# Altium schematic sheet Power.SchDoc
size A; SheetNumber: 5; SheetTotal: 8
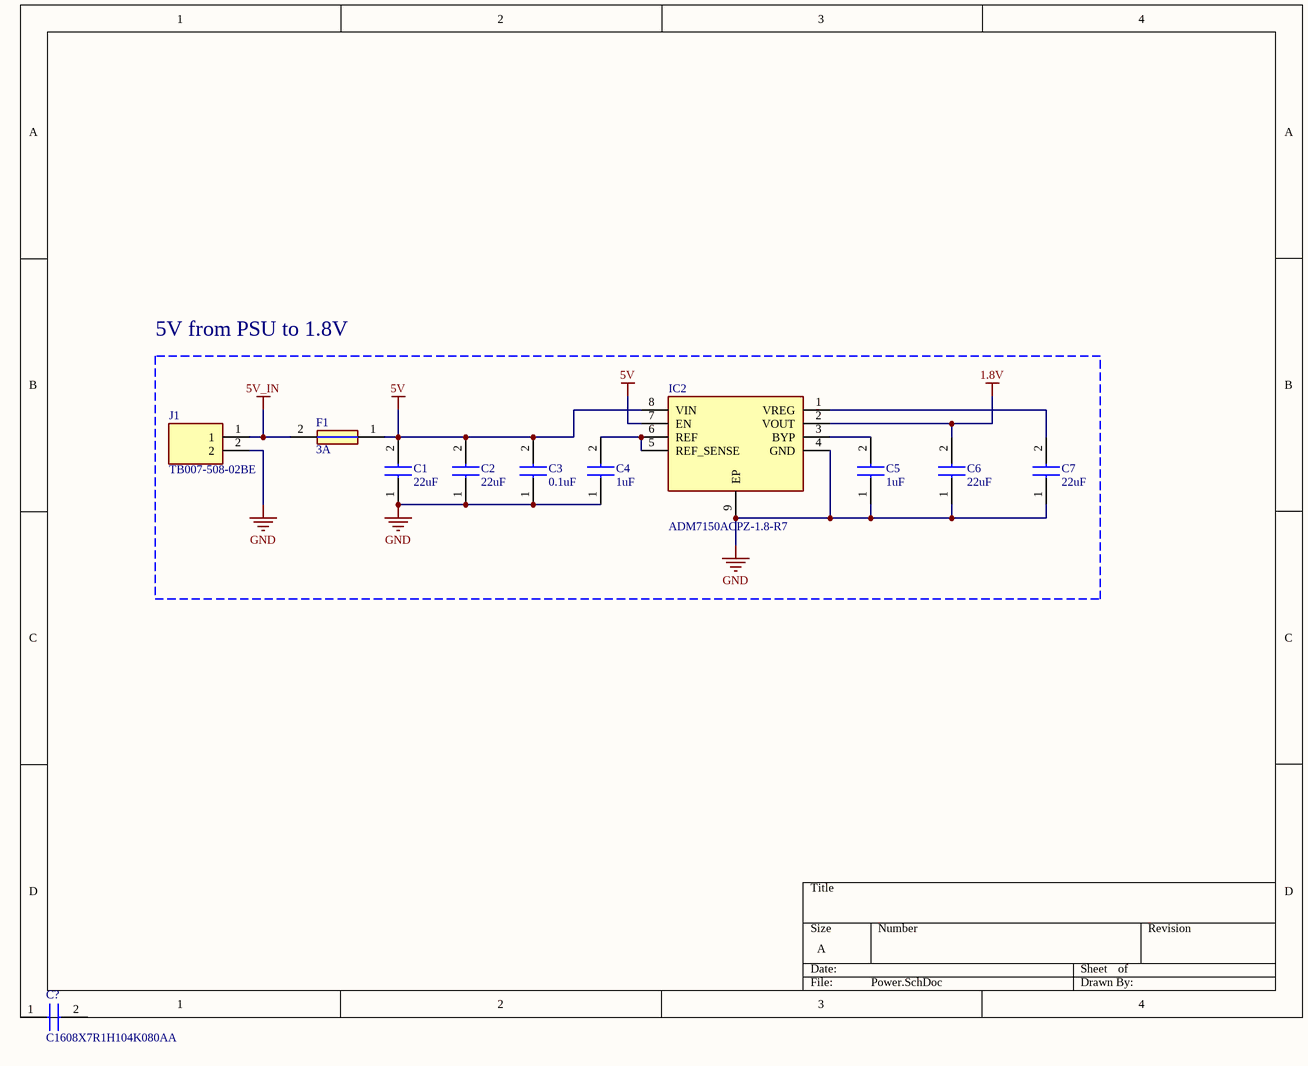
[diagram p0: Power.SchDoc]

## Parts
C1  22uF  [CAPC3225X230N]
C2  22uF  [CAPC3225X230N]
C3  0.1uF  [CAPC1608X80N]
C4  1uF  [CAPC1608X80N]
C5  1uF  [CAPC1608X80N]
C6  22uF  [CAPC3225X230N]
C7  22uF  [CAPC3225X230N]
C?  C1608X7R1H104K080AA  [CAPC1608X80N]
F1  3A  [FUSC3216X98N]
IC2  ADM7150ACPZ-1.8-R7  [SON50P300X300X85-9N-D]
J1  TB007-508-02BE  [TB007-508-02BE]

## Blocks framed on the sheet
5V from PSU to 1.8V: C1-C7 F1 IC2 J1

## Nets
1.8V: C6.2 IC2.2(VOUT)
5V: C1.2 C2.2 C3.2 F1.1 IC2.7(EN) IC2.8(VIN)
5V_IN: F1.2 J1.1
GND: C1.1 C2.1 C3.1 C4.1 C5.1 C6.1 C7.1 IC2.4(GND) IC2.9(EP) J1.2
NetC4_2: C4.2 IC2.5(REF_SENSE) IC2.6(REF)
NetC5_2: C5.2 IC2.3(BYP)
NetC7_2: C7.2 IC2.1(VREG)

Not connected (* = marked no-connect by the designer): C? 1 2

## Library data of the parts
C1 C2 C6 C7 = 1210 22uF Capacitor: C3225X7R1E226M250AB; Manufacturer_Name: TDK; Datasheet Link: https://product.tdk.com/info/en/catalog/datasheets/mlcc_commercial_midvoltage_en.pdf; Height: 2.3mm; Manufacturer_Part_Number: C3225X7R1E226M250AB; Mouser Part Number: 810-C3225X7R1EM250AB; Mouser Price/Stock: https://www.mouser.co.uk/ProductDetail/TDK/C3225X7R1E226M250AB?qs=gZXFycFWdAOxso2lxwRfpg%3D%3D; Arrow Part Number: C3225X7R1E226M250AB; Arrow Price/Stock: https://www.arrow.com/en/products/c3225x7r1e226m250ab/tdk?region=nac
C3 = 0603 0.1uF Capacitor: C1608X7R1H104K080AA; Manufacturer_Name: TDK; Datasheet Link: https://product.tdk.com/info/en/catalog/datasheets/mlcc_commercial_midvoltage_en.pdf; Height: 0.8mm; Manufacturer_Part_Number: C1608X7R1H104K080AA; Mouser Part Number: 810-C1608X7R1H104K; Mouser Price/Stock: https://www.mouser.co.uk/ProductDetail/TDK/C1608X7R1H104K080AA?qs=NRhsANhppD8dEJli2CDBHA%3D%3D; Arrow Part Number: C1608X7R1H104K080AA; Arrow Price/Stock: https://www.arrow.com/en/products/c1608x7r1h104k080aa/tdk.html?utm_currency=USD&region=asia
C4 C5 = 0603 1uF Capacitor: C1608X7R1C105K080AC; Manufacturer_Name: TDK; Datasheet Link: https://product.tdk.com/info/en/catalog/datasheets/mlcc_commercial_midvoltage_en.pdf; Height: 0.8mm; Manufacturer_Part_Number: C1608X7R1C105K080AC; Mouser Part Number: 810-C1608X7R1C105K; Mouser Price/Stock: https://www.mouser.co.uk/ProductDetail/TDK/C1608X7R1C105K080AC?qs=NRhsANhppD%2FMM4SE1SUXmg%3D%3D; Arrow Part Number: C1608X7R1C105K080AC; Arrow Price/Stock: https://www.arrow.com/en/products/c1608x7r1c105k080ac/tdk?utm_currency=USD&region=nac
C? = C1608X7R1H104K080AA: Capacitor; Manufacturer_Name: TDK; Datasheet Link: https://product.tdk.com/info/en/catalog/datasheets/mlcc_commercial_midvoltage_en.pdf; Height: 0.8mm; Manufacturer_Part_Number: C1608X7R1H104K080AA; Mouser Part Number: 810-C1608X7R1H104K; Mouser Price/Stock: https://www.mouser.co.uk/ProductDetail/TDK/C1608X7R1H104K080AA?qs=NRhsANhppD8dEJli2CDBHA%3D%3D; Arrow Part Number: C1608X7R1H104K080AA; Arrow Price/Stock: https://www.arrow.com/en/products/c1608x7r1h104k080aa/tdk.html?utm_currency=USD&region=asia
F1 = 0407003.WRA: 3A Slow-Blow Fuse, 32V; Manufacturer_Name: LITTELFUSE; Datasheet Link: https://cdn1-originals.webdamdb.com/12956_127233622?cache=1686747046&response-content-disposition=inline;filename=Littelfuse_Fuse_407A_Datasheet.pdf&response-content-type=application/pdf&Policy=eyJTdGF0ZW1lbnQiOlt7IlJlc291cmNlIjoiaHR0cCo6Ly9jZG4xLW9yaWdpb; Height: 0.985mm; Manufacturer_Part_Number: 0407003.WRA; Mouser Part Number: 576-0407003.WRA; Mouser Price/Stock: https://www.mouser.co.uk/ProductDetail/Littelfuse/0407003.WRA?qs=QNEnbhJQKvag6lfcn2%2FiyQ%3D%3D
IC2 = ADM7150ACPZ-1.8-R7: Integrated Circuit; Manufacturer_Name: Analog Devices; Datasheet Link: https://www.analog.com/media/en/technical-documentation/data-sheets/ADM7150.pdf; Height: 0.85mm; Manufacturer_Part_Number: ADM7150ACPZ-1.8-R7; Mouser Part Number: 584-ADM7150ACPZ1.8R7; Mouser Price/Stock: https://www.mouser.co.uk/ProductDetail/Analog-Devices/ADM7150ACPZ-1.8-R7?qs=y2kkmE52mdMoOvxUkkHOHg%3D%3D; Arrow Part Number: ADM7150ACPZ-1.8-R7; Arrow Price/Stock: https://www.arrow.com/en/products/adm7150acpz-1.8-r7/analog-devices.html?utm_currency=USD&region=nac
J1 = TB007-508-02BE: Connector; Manufacturer_Name: Same Sky; Datasheet Link: https://www.sameskydevices.com/product/resource/supplyframepdf/tb007-508.pdf; Height: 14mm; Manufacturer_Part_Number: TB007-508-02BE; Mouser Part Number: 490-TB007-508-02BE; Mouser Price/Stock: https://www.mouser.co.uk/ProductDetail/Same-Sky/TB007-508-02BE?qs=vLWxofP3U2y6PFKAfCqKUQ%3D%3D; Arrow Part Number: TB007-508-02BE; Arrow Price/Stock: https://www.arrow.com/en/products/tb007-508-02be/cui-devices.html?utm_currency=USD&region=asia